# EAGLE design Honda Fit CAN Gateway (EAGLE 7.4.0)

## Sheet 1 of 2
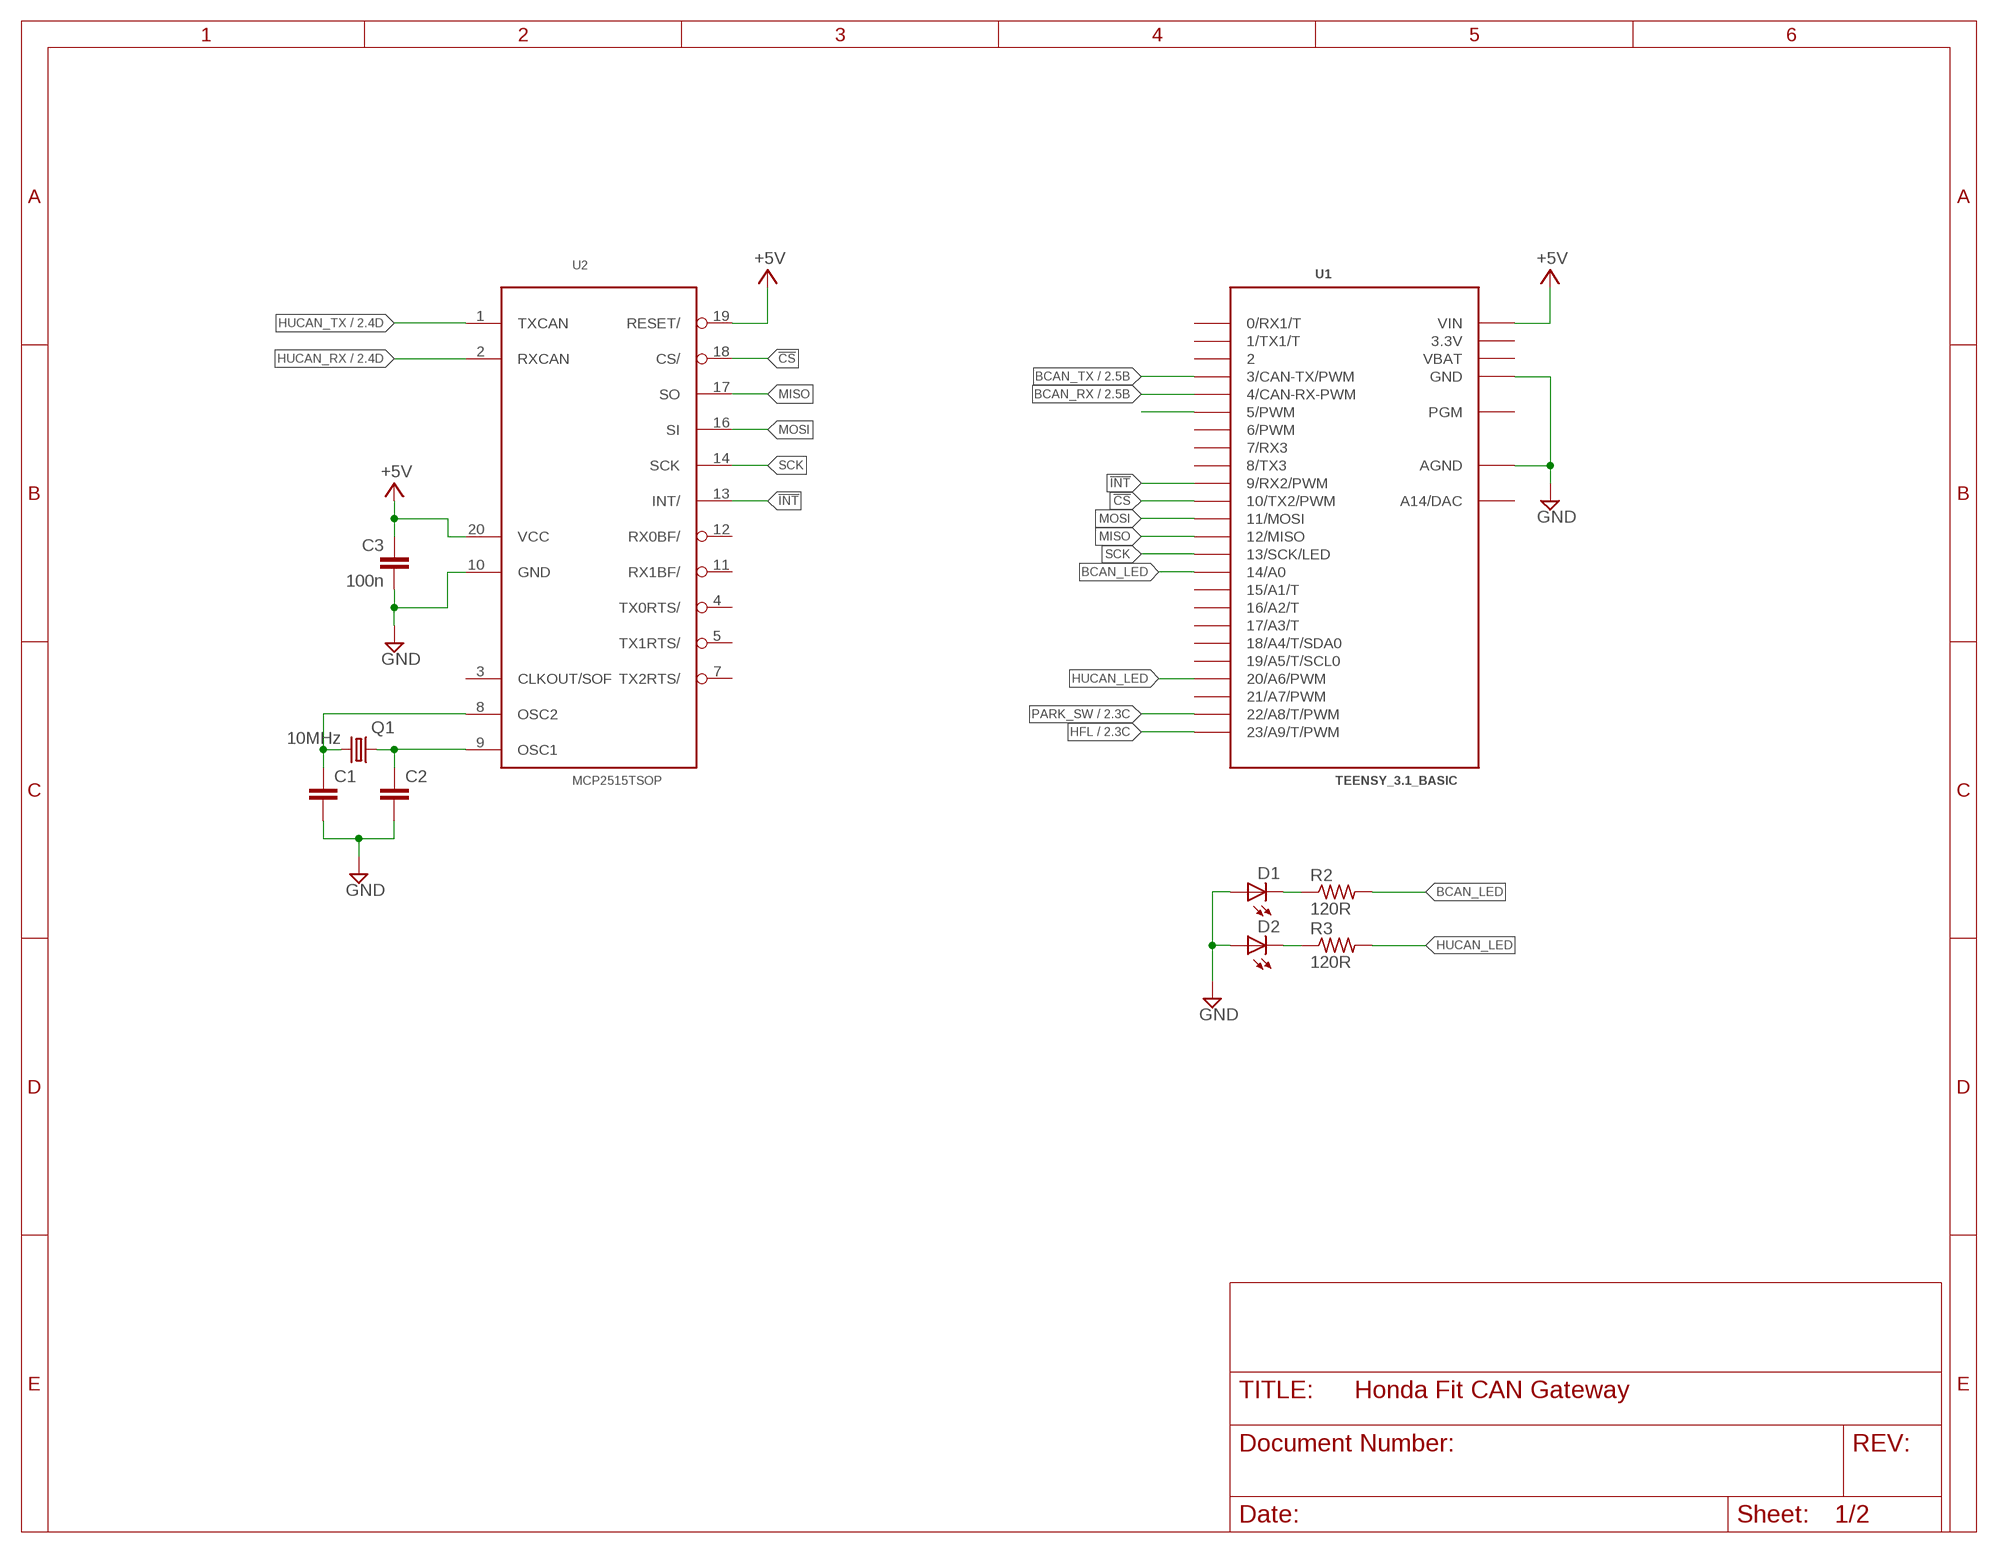
[diagram p0: schematic, sheet 1]

### Parts
C1  C-EUC0603  [C0603]
C2  C-EUC0603  [C0603]
C3  100n  C-EUC0603  [C0603]
D1  LEDCHIP-LED0805  [CHIP-LED0805]
D2  LEDCHIP-LED0805  [CHIP-LED0805]
Q1  10MHz  CRYSTALHC49S  [HC49/S]
R2  120R  R-US_R0805  [R0805]
R3  120R  R-US_R0805  [R0805]
U1  TEENSY_3.1_BASIC  [TEENSY_3.1_BASIC]
U2  MCP2515TSOP  [TSSOP20]

### Nets
!CS: U1.10(10/TX2/PWM) U2.18(CS/)
!INT: U1.9(9/RX2/PWM) U2.13(INT/)
+5V: C3.1 U1.VIN U2.19(RESET/) U2.20(VCC) ; also sheet 2
BCAN_LED: R2.2 U1.14/A0
BCAN_RX: U1.4(4/CAN-RX-PWM) ; also sheet 2
BCAN_TX: U1.3(3/CAN-TX/PWM) ; also sheet 2
GND: C1.2 C2.2 C3.2 D1.A D2.A U1.AGND U1.GND U1.GND1(GND) U2.10(GND) ; also sheet 2
HFL: U1.23/A9(23/A9/T/PWM) ; also sheet 2
HUCAN_LED: R3.2 U1.20/A6(20/A6/PWM)
HUCAN_RX: U2.2(RXCAN) ; also sheet 2
HUCAN_TX: U2.1(TXCAN) ; also sheet 2
MISO: U1.12(12/MISO) U2.17(SO)
MOSI: U1.11(11/MOSI) U2.16(SI)
N$1: C1.1 Q1.2 U2.8(OSC2)
N$2: C2.1 Q1.1 U2.9(OSC1)
N$3: U1.5(5/PWM)
N$4: D1.C R2.1
N$5: D2.C R3.1
PARK_SW: U1.22/A8(22/A8/T/PWM) ; also sheet 2
SCK: U1.13(13/SCK/LED) U2.14(SCK)
Unconnected: U1.0(0/RX1/T) U1.1(1/TX1/T) U1.2 U1.6(6/PWM) U1.7(7/RX3) U1.8(8/TX3) U1.15/A1(15/A1/T) U1.16/A2(16/A2/T) U1.17/A3(17/A3/T) U1.18/A4(18/A4/T/SDA0) U1.19/A5(19/A5/T/SCL0) U1.21/A7(21/A7/PWM) U1.A14(A14/DAC) U1.PGM U2.3(CLKOUT/SOF) U2.4(TX0RTS/) U2.5(TX1RTS/) U2.7(TX2RTS/) U2.11(RX1BF/) U2.12(RX0BF/)

## Sheet 2 of 2
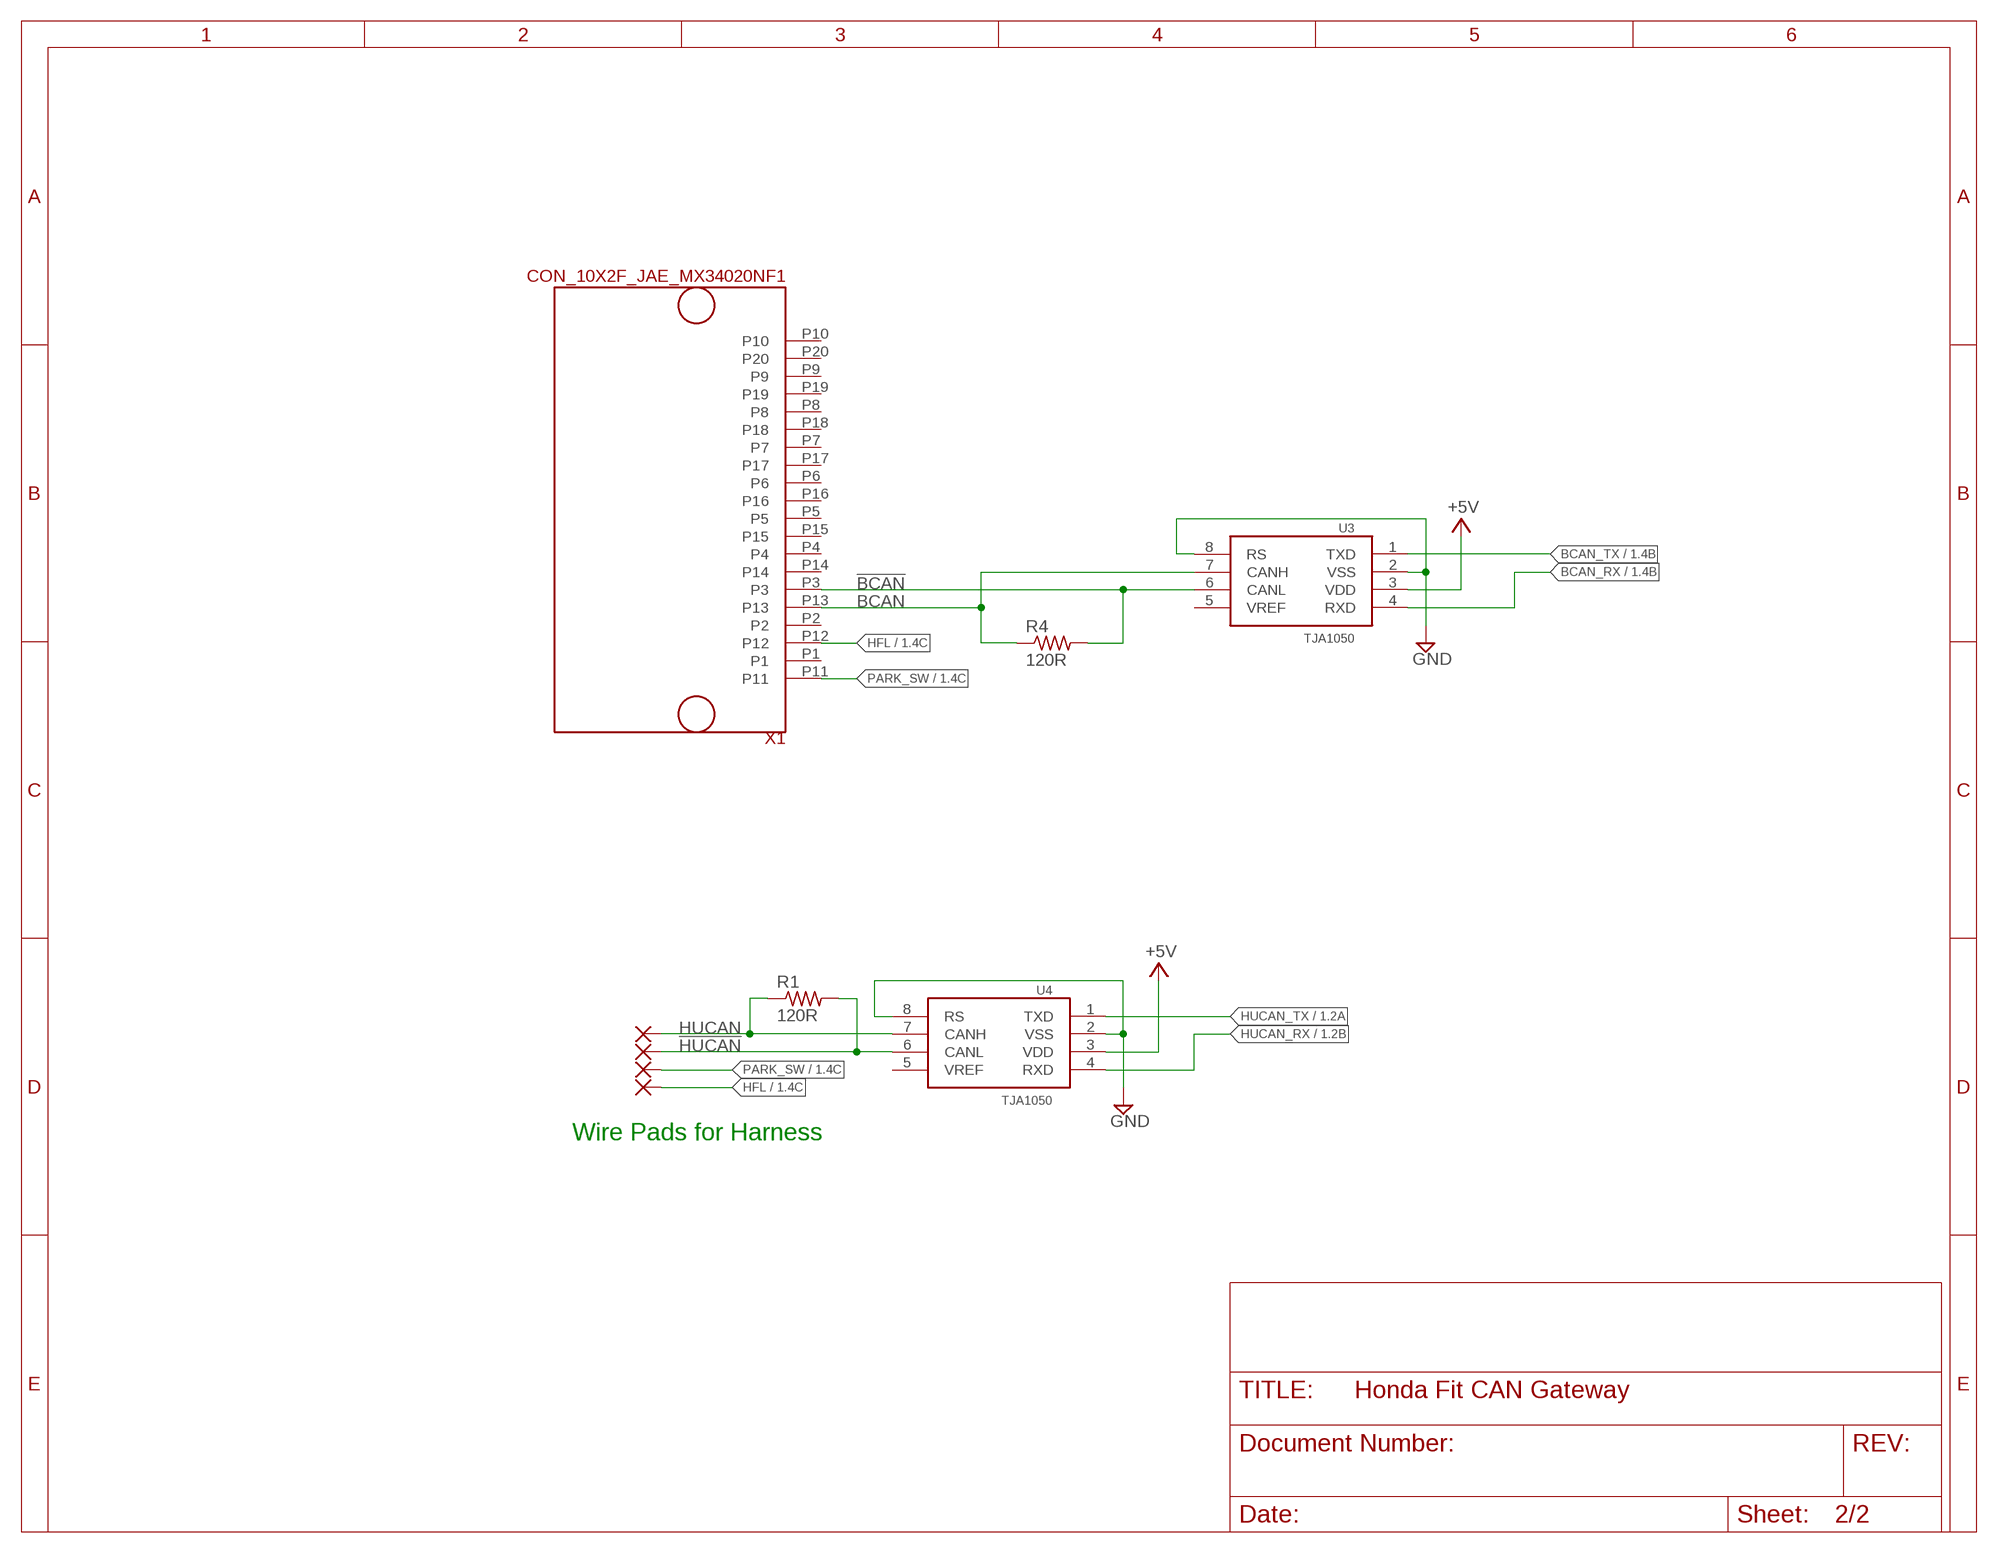
[diagram p1: schematic, sheet 2]

### Parts
PAD1  3,17/1,3  [3,17/1,3]
PAD2  3,17/1,3  [3,17/1,3]
PAD3  3,17/1,3  [3,17/1,3]
PAD4  3,17/1,3  [3,17/1,3]
R1  120R  R-US_R0805  [R0805]
R4  120R  R-US_R0805  [R0805]
U3  TJA1050  [SO08]
U4  TJA1050  [SO08]
X1  CON_10X2F_JAE_MX34020NF1  [CON_10X2_JAE_MX34020NF1]

### Nets
!BCAN: R4.2 U3.6(CANL) X1.P3
!HUCAN: PAD2.1(P) R1.2 U4.6(CANL)
+5V: U3.3(VDD) U4.3(VDD) ; also sheet 1
BCAN: R4.1 U3.7(CANH) X1.P13
BCAN_RX: U3.4(RXD) ; also sheet 1
BCAN_TX: U3.1(TXD) ; also sheet 1
GND: U3.2(VSS) U3.8(RS) U4.2(VSS) U4.8(RS) ; also sheet 1
HFL: PAD4.1(P) X1.P12 ; also sheet 1
HUCAN: PAD1.1(P) R1.1 U4.7(CANH)
HUCAN_RX: U4.4(RXD) ; also sheet 1
HUCAN_TX: U4.1(TXD) ; also sheet 1
PARK_SW: PAD3.1(P) X1.P11 ; also sheet 1
Unconnected: U3.5(VREF) U4.5(VREF) X1.P1 X1.P2 X1.P4 X1.P5 X1.P6 X1.P7 X1.P8 X1.P9 X1.P10 X1.P14 X1.P15 X1.P16 X1.P17 X1.P18 X1.P19 X1.P20

### Notes on the sheet
- Wire Pads for Harness

## Power pins joined to a net without a drawn wire
3.3V: U1.3.3V U1.3.3V1(3.3V)
VBAT: U1.VBAT

## Library data of the parts
C1-C3 = resistor:C-EU: CAPACITOR, European symbol
D1 D2 = led:LED: LED OSRAM: - CHIPLED LG R971, LG N971, LY N971, LG Q971, LY Q971, LO R971, LY R971 LH N974, LH R974 LS Q976, LO Q976, LY Q976 LO Q996 - Hyper CHIPLED LW Q18S LB Q993, LB Q99A, LB R99A - SideLED LS A670, LO A670, LY A670, LG A670, LP A670 LB A673, LV A673, LT A673, LW A673 LH A674 LY A675 LS A676, LA A676, LO A676, LY A676, LW A676 LS A679, LY A679, LG A679 - Hyper Micro SIDELED® LS Y876, LA Y876, LO Y876, LY Y876 LT Y87S - SmartLED LW L88C, LW L88S LB L89C, LB L89S, LG L890 LS L89K, LO L89K, LY L89K LS L896, LA L896, LO L896, LY L896 - TOPLED LS T670, LO T670, LY T670, LG T670, LP T670 LSG T670, LSP T670, LSY T670, LOP T670, LYG T670 LG T671, LOG T671, LSG T671 LB T673, LV T673, LT T673, LW T673 LH T674 LS T676, LA T676, LO T676, LY T676, LB T676, LH T676, LSB T676, LW T676 LB T67C, LV T67C, LT T67C, LS T67K, LO T67K, LY T67K, LW E67C LS E67B, LA E67B, LO E67B, LY E67B, LB E67C, LV E67C, LT E67C LW T67C LS T679, LY T679, LG T679 LS T770, LO T770, LY T770, LG T770, LP T770 LB T773, LV T773, LT T773, LW T773 LH T774 LS E675, LA E675, LY E675, LS T675 LS T776, LA T776, LO T776, LY T776, LB T776 LHGB T686 LT T68C, LB T68C - Hyper Mini TOPLED® LB M676 - Mini TOPLED Santana® LG M470 LS M47K, LO M47K, LY M47K Source: http://www.osram.convergy.de LUXEON: - LUMILED® LXK2-PW12-R00, LXK2-PW12-S00, LXK2-PW14-U00, LXK2-PW14-V00 LXK2-PM12-R00, LXK2-PM12-S00, LXK2-PM14-U00 LXK2-PE12-Q00, LXK2-PE12-R00, LXK2-PE12-S00, LXK2-PE14-T00, LXK2-PE14-U00 LXK2-PB12-K00, LXK2-PB12-L00, LXK2-PB12-M00, LXK2-PB14-N00, LXK2-PB14-P00, LXK2-PB14-Q00 LXK2-PR12-L00, LXK2-PR12-M00, LXK2-PR14-Q00, LXK2-PR14-R00 LXK2-PD12-Q00, LXK2-PD12-R00, LXK2-PD12-S00 LXK2-PH12-R00, LXK2-PH12-S00 LXK2-PL12-P00, LXK2-PL12-Q00, LXK2-PL12-R00 Source: www.luxeon.com KINGBRIGHT: KA-3528ASYC Source: www.kingbright.com
PAD1-PAD4 = wirepad:3,17/1,3: THROUGH-HOLE PAD
Q1 = crystal:CRYSTAL: CRYSTAL; OC_FARNELL: 1667008; OC_NEWARK: unknown
R1-R4 = resistor:R-US_: RESISTOR, American symbol
U1 = Teensy_3_Series_Board_v1.0:TEENSY_3.1_BASIC: Footprint for Teensy 3.1 board using all pin connections on the outer perimeter
U2 = MCP2515_MT:MCP2515*: MCP2515 Standalone CAN-Controller by Microchip Eagle-Lib. by MartinThomas
U3 U4 = can_driver:TJA1050: High speed CAN transceiver Input levels compatible with 3.3 V and 5 V devices 5V supply
X1 = JAE_MX34:CON_10X2F_JAE_MX34020NF1: JAE MX34 Series Connector, 10x2 Rows

## Board
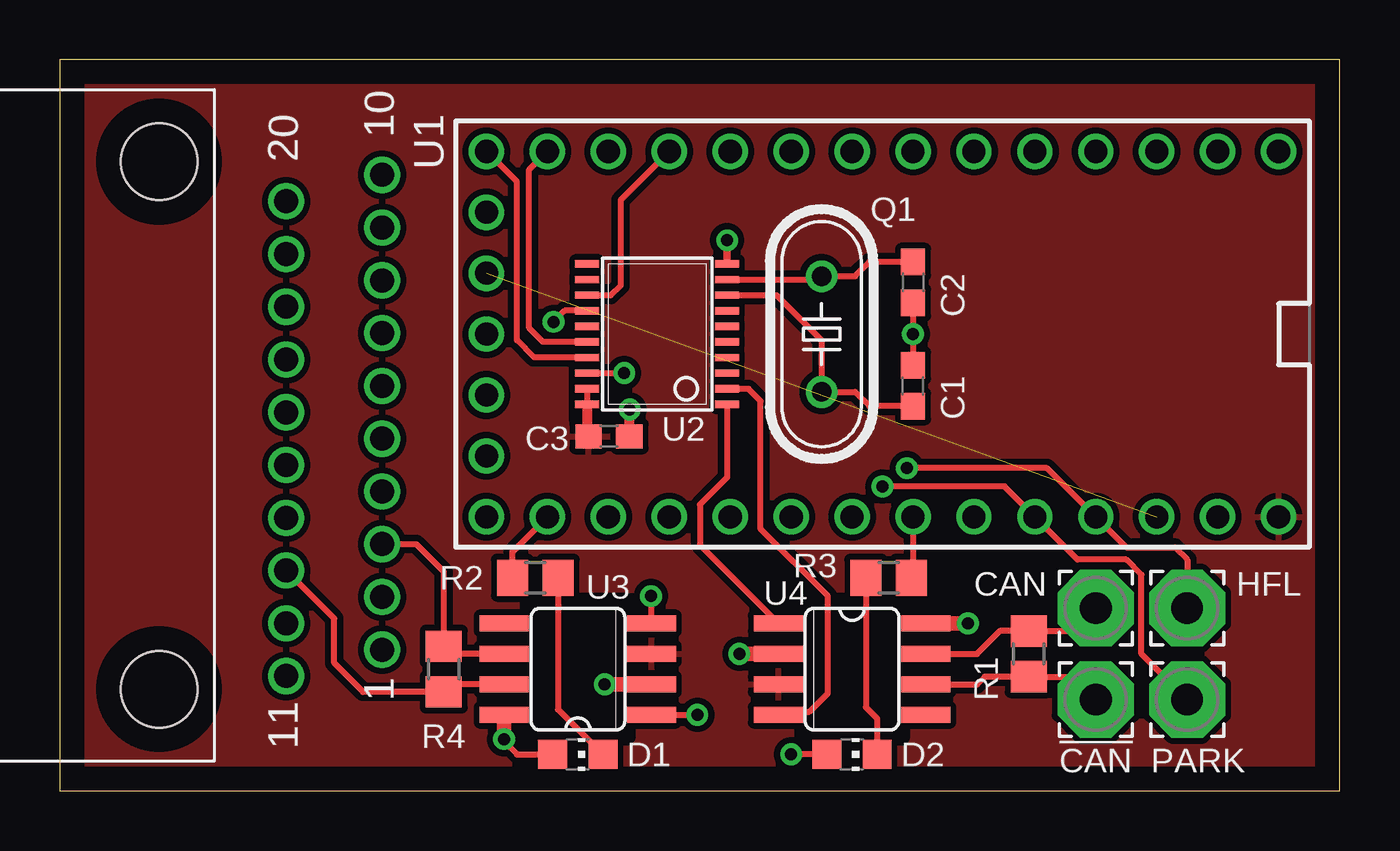
[diagram p2: board, top side]
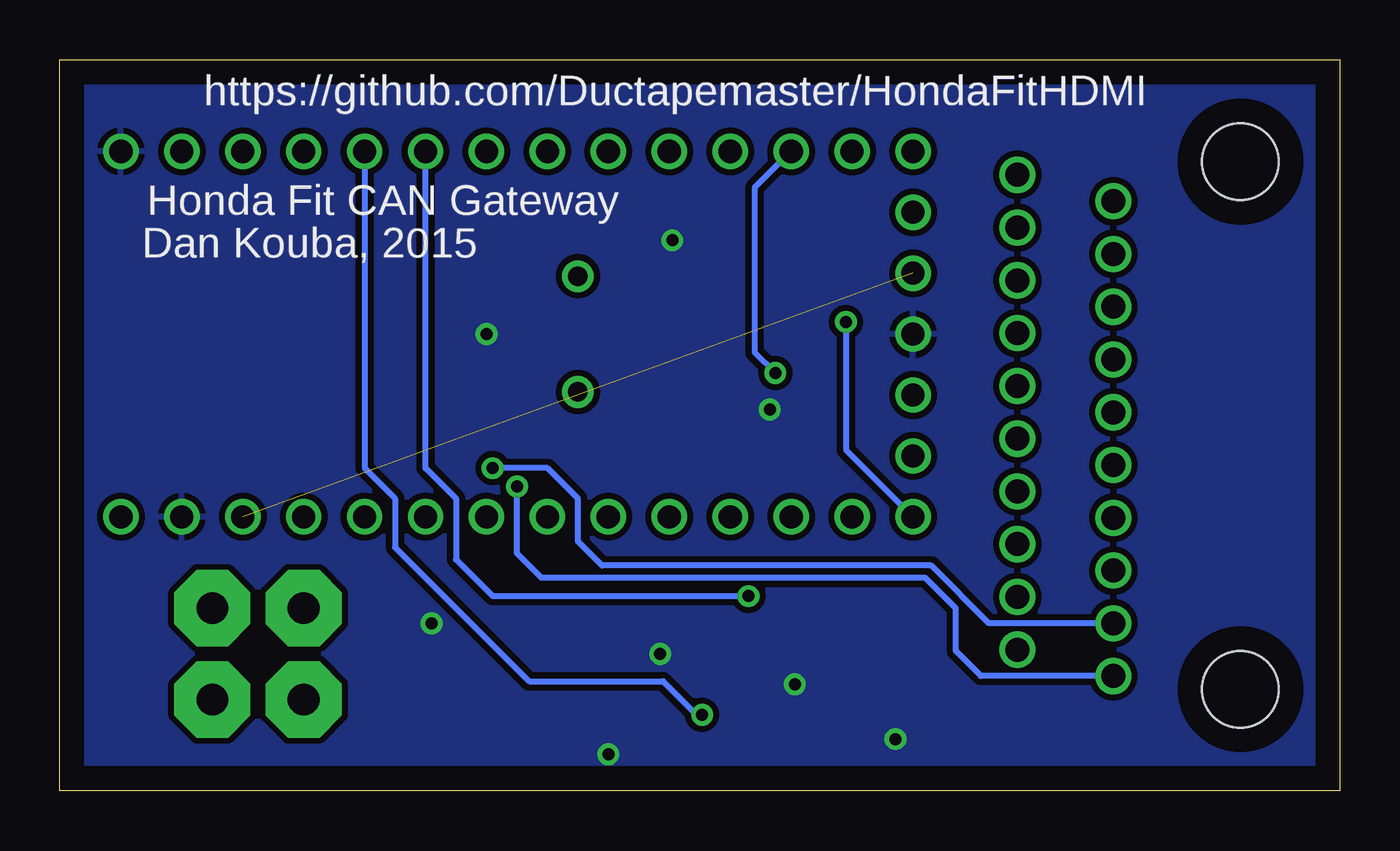
[diagram p3: board, bottom side, seen from below]

Size 53.34 x 30.48 mm. Coordinates in mm from the lower left corner, seen from the top.
Outline: 0,0 53.34,0 53.34,30.48 0,30.48 0,0
Copper layers (1*16): Top 0.035mm / dielectric 1.5mm / Bottom 0.035mm
Design rules "default": minimum track width 10mil, minimum drill 24mil, track to track 8mil, track to pad 8mil, pad to pad 8mil, via to via 8mil, smd to smd 8mil, copper to edge 40mil, drill to drill 8mil, minimum pad ring 10mil, minimum via ring 8mil, stop-mask expansion 4mil, vias tented up to drill 0mil, thermal gap 10mil
tRestrict: area 21.6,15.5 to 22.4,17.5; area 19.6,2.3 to 23.6,7.9; area 31,2.3 to 35.1,7.9

### Footprints (pad centres in the part's own frame; a part is rotated, then mirrored left to right if it is on the bottom)
C0603 = smd 1.1 x 1: 1 -0.85,0; 2 0.85,0
CHIP-LED0805 = smd 1.2 x 1.2: A 0,-1.05; C 0,1.05
3,17/1,3 = drill 1.321 pad 3.175 octagon: 1 0,0
HC49/S = drill 0.813: 1 -2.413,0; 2 2.413,0
R0805 = smd 1.3 x 1.5: 1 -0.95,0; 2 0.95,0
TEENSY_3.1_BASIC = drill 0.965: 0 -7.62,13.97; 1 -7.62,11.43; 2 -7.62,8.89; 3 -7.62,6.35; 3.3V 7.62,11.43; 3.3V1 -2.54,-16.51; 4 -7.62,3.81; 5 -7.62,1.27; 6 -7.62,-1.27; 7 -7.62,-3.81; 8 -7.62,-6.35; 9 -7.62,-8.89; 10 -7.62,-11.43; 11 -7.62,-13.97; 12 -7.62,-16.51; 13 7.62,-16.51; 14/A0 7.62,-13.97; 15/A1 7.62,-11.43; 16/A2 7.62,-8.89; 17/A3 7.62,-6.35; 18/A4 7.62,-3.81; 19/A5 7.62,-1.27; 20/A6 7.62,1.27; 21/A7 7.62,3.81; 22/A8 7.62,6.35; 23/A9 7.62,8.89; A14 5.08,-16.51; AGND 7.62,13.97; GND -7.62,16.51; GND1 0,-16.51; PGM 2.54,-16.51; VBAT -5.08,-16.51; VIN 7.62,16.51
TSSOP20 = smd 0.305 x 0.991: 1 -2.925,-2.918; 2 -2.275,-2.918; 3 -1.625,-2.918; 4 -0.975,-2.918; 5 -0.325,-2.918; 6 0.325,-2.918; 7 0.975,-2.918; 8 1.625,-2.918; 9 2.275,-2.918; 10 2.925,-2.918; 11 2.925,2.918; 12 2.275,2.918; 13 1.625,2.918; 14 0.975,2.918; 15 0.325,2.918; 16 -0.325,2.918; 17 -0.975,2.918; 18 -1.625,2.918; 19 -2.275,2.918; 20 -2.925,2.918
SO08 = smd 0.66 x 2.032: 1 -1.905,-3.073; 2 -0.635,-3.073; 3 0.635,-3.073; 4 1.905,-3.073; 5 1.905,3.073; 6 0.635,3.073; 7 -0.635,3.073; 8 -1.905,3.073
CON_10X2_JAE_MX34020NF1 = drill 1: P1 -2,9.35; P2 -2,7.15; P3 -2,4.95; P4 -2,2.75; P5 -2,0.55; P6 -2,-1.65; P7 -2,-3.85; P8 -2,-6.05; P9 -2,-8.25; P10 -2,-10.45; P11 2,10.45; P12 2,8.25; P13 2,6.05; P14 2,3.85; P15 2,1.65; P16 2,-0.55; P17 2,-2.75; P18 2,-4.95; P19 2,-7.15; P20 2,-9.35 | hole 3.2: 7.3,11; 7.3,-11

### Placement (x,y rotation side)
C1  35.56,16.89 90 top
C2  35.56,21.21 270 top
C3  22.89,14.78 0 top
D1  21.59,1.52 270 top
D2  33.02,1.52 270 top
PAD1  43.18,7.62 0 top
PAD2  43.18,3.81 0 top
PAD3  46.99,3.81 0 top
PAD4  46.99,7.62 0 top
Q1  31.75,19.05 270 top
R1  40.39,5.71 270 top
R2  19.81,8.89 180 top
R3  34.54,8.89 0 top
R4  16,5.08 90 top
U1  34.29,19.05 270 top
U2  24.89,19.05 90 top
U3  21.59,5.08 90 top
U4  33.02,5.08 270 top
X1  11.43,15.24 180 top

### Tracks (layer width: path | path; a pad name or v marks a point on that pad's centre or on a via)
3.3V  (1 unrouted)
!BCAN
  Top 0.254: X1.P3 14.86,10.29 16,9.14 R4.2 16.32,5.71 U3.6
!CS  (via drill 0.5)
  Top 0.254: U2.18 v23.52,17.43 v23.52,17.42
  Bottom 0.254: U1.10 24.38,25.15 24.38,18.29 v23.52,17.42
!HUCAN
  Top 0.254: PAD2.1 42.23,4.76 R1.2 38.55,4.76 38.23,4.45 U4.6
!INT
  Top 0.254: U1.9 23.37,24.64 23.37,21.08 22.96,20.68 U2.13
+5V
  Top 0.254: U2.19 U2.20
  Top 0.406: U2.20 21.97,15 C3.1
  pour Top (isolate 0.254): 0,30.48 0,0 53.34,0 53.34,30.48
BCAN
  Top 0.254: X1.P13 11.43,7.19 11.43,5.33 12.63,4.13 R4.1 16.32,4.45 U3.7
BCAN_LED
  Top 0.254: U1.14/A0 18.86,9.97 R2.2
BCAN_RX  (via drill 0.5)
  Top 0.254: v24.64,8.13 24.64,7.01 U3.4
  Bottom 0.254: U1.4 38.1,13.46 36.83,12.19 36.83,9.65 35.31,8.13 v24.64,8.13
BCAN_TX  (via drill 0.5)
  Top 0.254: U3.1 v26.57,3.17
  Bottom 0.254: U1.3 40.64,13.46 39.37,12.19 39.37,10.16 33.78,4.57 28.19,4.57 26.8,3.17 v26.57,3.17
GND  (via drill 0.5)
  Top 0.254: D2.A v30.48,1.52 | v18.52,2.16 18.52,2.06 19.05,1.52 D1.A | C2.2 v35.56,19.05 C1.2
  Top 0.305: U2.10 v27.81,22.96
  Top 0.406: C3.2 23.73,15.89 v23.75,15.9
  Top 0.61: U3.2 v22.71,4.45 | U4.2 v28.32,5.71 | U4.8 v37.85,6.99 | U3.8 v18.52,2.16
  pour Bottom (isolate 0.254): 0,30.48 0,0 53.34,0 53.34,30.48
HFL  (via drill 0.5)
  Top 0.254: PAD4.1 46.99,9.65 46.48,10.16 44.45,10.16 U1.23/A9 41.15,13.46 v35.31,13.46
  Bottom 0.254: X1.P12 14.61,6.99 17.02,9.4 30.73,9.4 31.75,10.41 31.75,12.19 33.02,13.46 v35.31,13.46
HUCAN
  Top 0.254: PAD1.1 42.23,6.67 R1.1 39.18,6.67 38.23,5.71 U4.7
HUCAN_LED
  Top 0.254: U1.20/A6 35.56,8.96 R3.2
HUCAN_RX
  Top 0.254: U4.4 29.97,3.3 31.24,3.3 32,4.06 32,8.13 29.21,10.92 29.21,16.26 28.7,16.76 27.82,16.76 U2.2
HUCAN_TX
  Top 0.254: 29.72,7.11 U4.1 26.67,10.26 26.67,11.94 27.81,13.08 U2.1
MISO
  Top 0.254: U2.17 19.77,18.07 19.05,18.8 19.05,25.4 U1.12
MOSI
  Top 0.254: U2.16 20.14,18.73 19.56,19.3 19.56,25.91 U1.11
N$1
  Top 0.254: C1.1 33.74,16.04 33.15,16.64 Q1.2 31.75,18.8 29.87,20.68 U2.8
N$2
  Top 0.254: C2.1 33.74,22.06 33.15,21.46 Q1.1 31.61,21.32 U2.9
N$4
  Top 0.254: 22.61,1.52 22.61,1.56 D1.C 20.76,3.4 R2.1
N$5
  Top 0.254: R3.1 33.59,3.49 34.07,3.01 D2.C
PARK_SW  (via drill 0.5)
  Top 0.254: v34.29,12.7 39.37,12.7 U1.22/A8 42.42,9.65 44.45,9.65 45.09,9.02 45.09,5.71 PAD3.1
  Bottom 0.254: X1.P11 14.95,4.79 16,5.84 16,7.62 17.27,8.89 33.27,8.89 34.29,9.91 v34.29,12.7
SCK  (via drill 0.5)
  Top 0.254: U2.14 21.04,20.02 v20.57,19.56
  Bottom 0.254: v20.57,19.56 20.57,14.22 U1.13

### Text on the board
tNames: CAN | HFL | !CAN | PARK
bNames: https://github.com/Ductapemaster/HondaFitHDMI | Honda Fit CAN Gateway | Dan Kouba, 2015